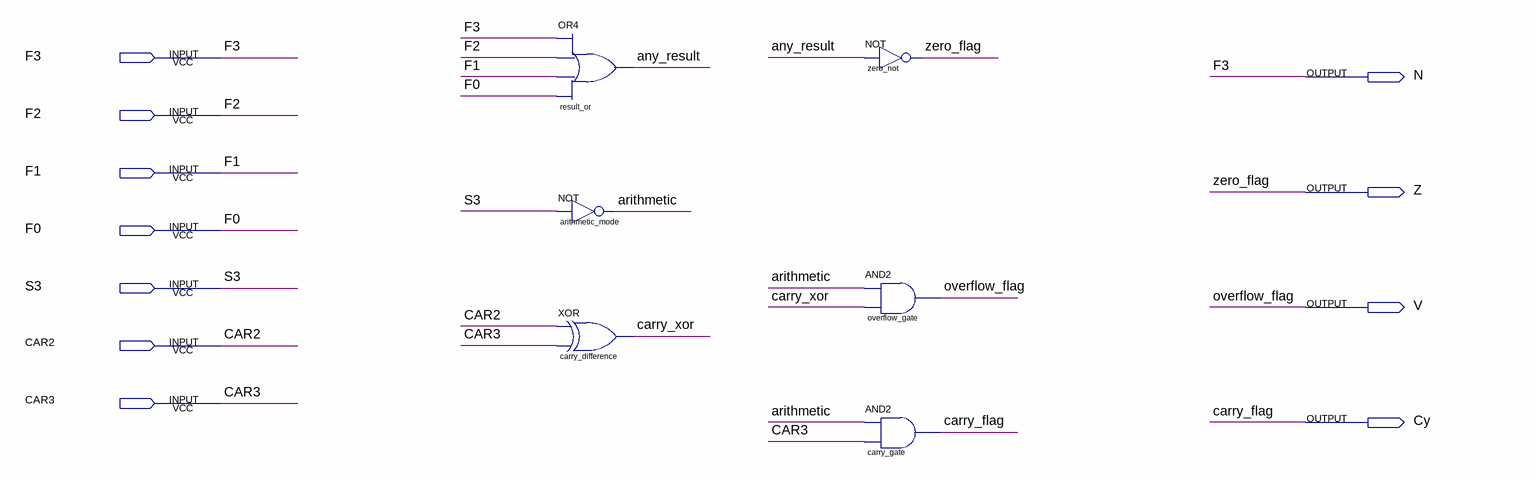
[diagram p0: schematic sheet]
// Quartus schematic state4bit.bdf as structural Verilog: 6 symbols, 11 pins
module state4bit (
  input  F3,
  input  F2,
  input  F1,
  input  F0,
  input  S3,
  input  CAR2,
  input  CAR3,
  output N,
  output Z,
  output V,
  output Cy
);

  wire any_result, arithmetic, carry_xor;

  or result_or (any_result, F3, F2, F1, F0);
  not arithmetic_mode (arithmetic, S3);
  xor carry_difference (carry_xor, CAR2, CAR3);
  not zero_not (Z, any_result);
  and overflow_gate (V, arithmetic, carry_xor);
  and carry_gate (Cy, arithmetic, CAR3);

  assign N = F3;

  // Other names for the same wires on the sheet: carry_flag = Cy; overflow_flag = V; zero_flag = Z
endmodule
